# Altium project Boost_Converter.PrjPcb
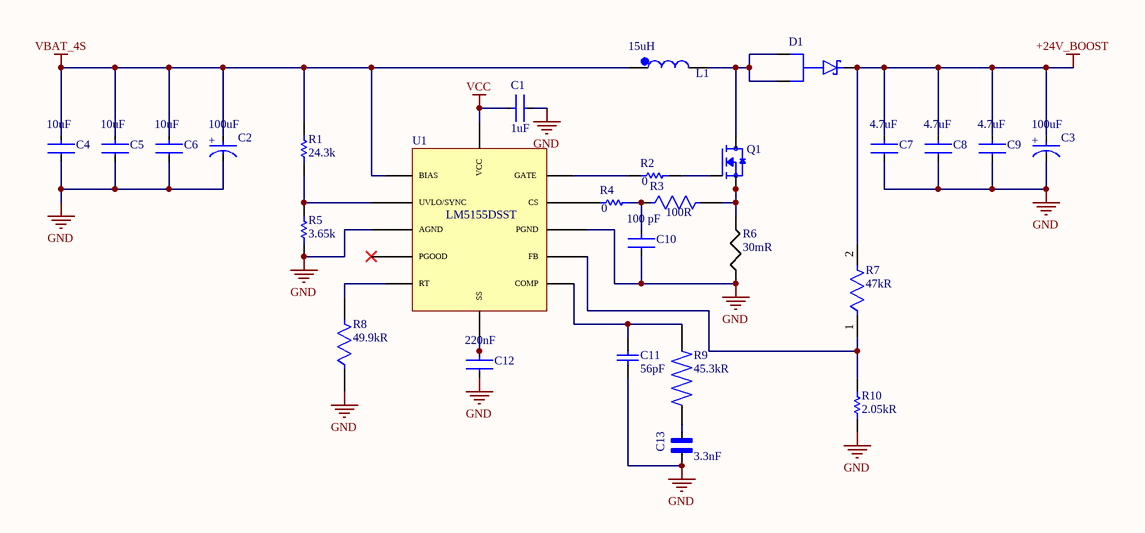
[diagram p0: boost_converter.SchDoc]
1 sheet, 27 parts. Net scope: global (net labels, ports and power ports of the same name join across sheets).
Board file: boost_converter.PcbDoc

## Sheet boost_converter.SchDoc
size A; SheetNumber: 1; SheetTotal: 1

### Parts
C1  Capacitance: 1uF  [FP-GCM188-0_1-IPC_B]  (hidden comment: C_vcc)
C2  Capacitance: 100uF  [FP-HXC-ALA0-MFG]  (hidden comment: C_in)
C3  Capacitance: 100uF  [FP-HXC-ALA0-MFG]  (hidden comment: C_out(bulk))
C4  Capacitance: 10uF  [FP-CL32-IPC_C]  (hidden comment: CL32B106KBJNNNE)
C5  Capacitance: 10uF  [FP-CL32-IPC_C]  (hidden comment: CL32B106KBJNNNE)
C6  Capacitance: 10uF  [FP-CL32-IPC_C]  (hidden comment: CL32B106KBJNNNE)
C7  Capacitance: 4.7uF  [FP-C3225-250-0_4-MFG]  (hidden comment: C_out)
C8  Capacitance: 4.7uF  [FP-C3225-250-0_4-MFG]  (hidden comment: C_out)
C9  Capacitance: 4.7uF  [FP-C3225-250-0_4-MFG]  (hidden comment: C_out)
C10  Capacitance: 100 pF  [FP-C0603C-CF-MFG]  (hidden comment: C_f)
C11  value 56pF  [CAPC1608X90X35NL10T15]  (hidden comment: C_hf)
C12  Capacitance: 220nF  [FP-GCM188-0_1-IPC_A]  (hidden comment: C_ss)
C13  value 3.3nF  [*CAPC1608X90N]  (hidden comment: C_comp)
D1  PMEG060V100EPDZ  [DIO_PMEG060V100EPDZ]  (value not drawn)
L1  value 15uH  [*IND_CSEB0660H-150M]  (hidden comment: Lm)
Q1  TSM056NH04LCR_RLG  [TRANS_TSM056NH04LCR_RLG]  (value not drawn)
R1  value 24.3k  [RESC1608X55X30NL15T15]  (hidden comment: R_uvlot)
R2  Resistance: 0  [RESC1608X55X25ML10T15]  (hidden comment: R_g)
R3  Resistance: 100R  [FP-AC0603-IPC_C]  (hidden comment: R_f)
R4  Resistance: 0  [RESC1608X55X25ML10T15]  (hidden comment: RC0603JR-070RL)
R5  value 3.65k  [RESC1608X55X30ML15T15]  (hidden comment: R_uvlob)
R6  30mR  [R_s]
R7  Resistance: 47kR  [FP-CRCW0603-e3-IPC_B]  (hidden comment: CRCW060347K0FKEA)
R8  Resistance: 49.9kR  [FP-CRCW0603-e3-IPC_B]  (hidden comment: R_t)
R9  45.3kR  [R_comp]
R10  value 2.05kR  [RESC1608X55X30ML15T15]  (hidden comment: R_fbb)
U1  LM5155DSST  [IC_LM5155DSST]

### Nets
+24V_BOOST: C3.2(A) C7.1 C8.1 C9.1 D1.3(K) R7.2
GND: C1.2 C2.1(C) C3.1(C) C4.2 C5.2 C6.2 C7.2 C8.2 C9.2 C10.2 C11.1 C12.2 C13.1 R5.1 R6.12 R8.1 R10.1 U1.16(AGND) U1.23(PGND)
VBAT_4S: C2.2(A) C4.1 C5.1 C6.1 L1.1 R1.2 U1.14(BIAS)
VCC: C1.1 U1.19(VCC)
NetC10_1: C10.1 R3.1 R4.2
NetC11_2: C11.2 R9.2 U1.21(COMP)
NetC12_1: C12.1 U1.20(SS)
NetC13_2: C13.2 R9.1
NetD1_1: D1.1(A1) D1.2(A2) L1.2 Q1.5_8(D)
NetQ1_1: Q1.1(S) Q1.2(S) Q1.3(S) R3.2 R6.13
NetQ1_4: Q1.4(G) R2.2
NetR1_1: R1.1 R5.2 U1.15(UVLO/SYNC)
NetR2_1: R2.1 U1.25(GATE)
NetR4_1: R4.1 U1.24(CS)
NetR7_1: R7.1 R10.2 U1.22(FB)
NetR8_2: R8.2 U1.18(RT)

Not connected (* = marked no-connect by the designer): U1 17(PGOOD)*

### Notes on the sheet
- (in symbol CMP-33769-000007-1) +

### Library data of the parts
C1 = CMP-2006-02357-2: Ceramic Capacitor for Automotive 1uF  ±10% 16VDC X7R 0603 Paper T/R; Voltage: 16V; Thickness: 0.035inch; Width: 0.031inch; Radiation Hardening: No; Depth: 0.8mm; Max Operating Temperature: 125°C; Package Quantity: 1; Ratings: AEC-Q200; Min Operating Temperature: -55°C; Packaging: Tape and Reel; Case Code (Metric): 1608; REACH SVHC: No SVHC; Dielectric: X7R; Case Code (Imperial): 0603; Length: 1.6mm; Height: 0.8mm; Voltage Rating: 16V; Termination: SMD/SMT; Case/Package: 0603; Voltage Rating (DC): 16V; Tolerance: 10%; Mount: Surface Mount; Lead Free: Lead Free
C2 C3 = CMP-33769-000007-1: CAP ALUM POLY 100UF 20% 50V SMD; Life (Hours): 4000Hour; ESR (Equivalent Series Resistance): 25mR; Packaging: Cut Tape; Case/Package: Radial; Resistor Type: Hybrid; Max Operating Temperature: 125°C; Voltage Rating: 50V; Min Operating Temperature: -55°C; RoHS Compliant: Yes; Tolerance: 20%; Ratings: AEC-Q200; Mount: Surface Mount
C4-C6 = CMP-2000-06110-2: Cap Ceramic 10uF 50V X7R ±10% SMD 1210 +125°C Embossed T/R; Material: Ceramic; Min Operating Temperature: -55°C; Depth: 2.5mm; Radiation Hardening: No; Packaging: Tape and Reel; Dielectric: X7R; Case Code (Metric): 3225; Height: 2.5mm; Thickness: 0.106inch; Voltage Rating (DC): 50V; Voltage Rating: 50V; Width: 0.098inch; Case Code (Imperial): 1210; Length: 3.2mm; Tolerance: 10%; Lead Free: Lead Free; Package Quantity: 1; Voltage: 50V; Mount: Surface Mount; Case/Package: 1210; Max Operating Temperature: 125°C
C7-C9 = CMP-08246-004459-1: Multilayer Ceramic Capacitors 4.7uF ±10% 50V X7R SMD 1210; Dielectric Material: Ceramic; Dielectric: X7R; Construction: Flat; Max Operating Temperature: 125°C; Case/Package: 1210; Weight: 0.000564oz; Voltage Rating: 50V; Depth: 2.5mm; Tolerance: 10%; Packaging: Tape and Reel; REACH SVHC: No SVHC; Case Code (Imperial): 1210; Thickness: 0.11inch; Termination: SMD/SMT; Radiation Hardening: No; Mount: Surface Mount; Number of Pins: 2; Min Operating Temperature: -55°C; Voltage Rating (DC): 50V; Resistor Type: Ceramic; Width: 0.098inch; Package Quantity: 1000; Length: 3.2mm; Height: 2.5mm; Case Code (Metric): 3225; Lead Free: Lead Free; RoHS Compliant: Yes; Series: C
C10 = CMP-2006-03418-2: CAP CER 100PF 50V 1% NP0 0603; Manufacturer Part Number: C0603C101F5GACTU; Manufacturer: KEMET; Material: Ceramic; Temperature Characteristic: C0G; Temperature Coefficient: 30ppm/°C; Tolerance: 0.01; Automotive Grade: Grade 1; Lead Free: Yes; Height: 0.87mm; Octopart: https://octopart.com/c0603c101f5gactu-kemet-8293493; Device Class L2: Capacitors; Device Class L1: Passive Components; ComponentLink2Description: Datasheet; Value: 100 pF; Package: C0603C-CF; Digikey Description: CAP CER 100PF 50V 1% NP0 0603; Device Class L3: Ceramic Capacitors; Mouser Description: Multilayer Ceramic Capacitors MLCC - SMD/SMT 50volts 100pF C0G 1%; Temperature: -55°C to +125°C; Category: Cap; Temperature Range High: +125°C; Temperature Range Low: -55°C; RoHS: TRUE; Voltage Rating: 50 V; Automotive: Yes; ComponentLink2URL: https://api.kemet.com/component-edge/download/datasheet/C0603C100J5GACAUTO.pdf
C11 = CMP-2006-02680-1: CAP CER 56PF 50V C0G/NP0 0603; Manufacturer: Murata; Part Number: GRM1885C1H560JA01D
C12 = CMP-2006-02383-2: Ceramic Capacitor for Automotive 220nF  ±10% 50VDC X7R 0603 Paper T/R; Voltage Rating (DC): 50V; Height: 0.8mm; Width: 0.031inch; Length: 1.6mm; Termination: SMD/SMT; Mount: Surface Mount; Depth: 0.8mm; REACH SVHC: No SVHC; Thickness: 0.035inch; Min Operating Temperature: -55°C; Case/Package: 0603; Max Operating Temperature: 125°C; Packaging: Tape and Reel; Dielectric: X7R; Package Quantity: 10; Voltage Rating: 50V; Tolerance: 10%; Ratings: AEC-Q200; Voltage: 50V; Lead Free: Lead Free; Radiation Hardening: No; Case Code (Metric): 1608; Case Code (Imperial): 0603
C13 = GRM188R72A332KA01J: CAP CER 3300PF 100V X7R 0603; SOURCE_URL: https://www.snapeda.com/parts/GRM188R72A332KA01J/Murata/view-part/?ref=snap
D1 = PMEG060V100EPDZ: Diode Schottky 60 V 10A Surface Mount CFP15; MF: Nexperia USA; SnapEDA_Link: https://www.snapeda.com/parts/PMEG060V100EPDZ/Nexperia/view-part/?ref=snap; Package: CFP15-3 Nexperia USA Inc.; Value: *; MP: PMEG060V100EPDZ; Check_prices: https://www.snapeda.com/parts/PMEG060V100EPDZ/Nexperia/view-part/?ref=eda
L1 = CSEB0660H-150M: FIXED IND 15UH 6A 43.8 MOHM SMD; MANUFACTURER: Codaca; UNIT: mm; MAXIMUM_PACKAGE_HEIGHT: 6.10mm; PARTREV: 09/15/2025; SOURCE_URL: https://www.snapeda.com/parts/CSEB0660H-150M/Codaca/view-part/?ref=snap; STANDARD: Manufacturer Recommendations
Q1 = TSM056NH04LCR_RLG: N-Channel Power Î©SFET 40V, 54A, 5.6mÎ©; MF: Taiwan Semiconductor; MP: TSM056NH04LCR RLG; SnapEDA_Link: https://www.snapeda.com/parts/TSM056NH04LCR%20RLG/taiwan/view-part/?ref=snap; Package: NON-STANDARD-5 Taiwan Semiconductor; Value: *; Check_prices: https://www.snapeda.com/parts/TSM056NH04LCR%20RLG/taiwan/view-part/?ref=eda
R1 = CMP-2000-00366-1: RES SMD 24.3K OHM 1% 1/10W 0603; Part Number: ERJ-3EKF2432V; Manufacturer: Panasonic
R2 R4 = CMP-2100-03667-1: Chip Resistor, 0 Ohm, +/- 5%, 0.1 W, -55 to 155 degC, 0603 (1608 Metric), RoHS, Tape and Reel; Manufacturer: Yageo; Temperature Coefficient: 200ppm/degreesC; Voltage Rating: 50V; Power Rating: 100mW; Width: 0.8mm; Max Operating Temperature: 155degC; Tolerance: 5%; Package Reference: 0603; Height: 0.45mm; Depth: 0.8mm; Package Description: 2-Pin Surface Mount Device, Body 1.6 x 0.8 mm; Termination: SMD/SMT; Package Quantity: 5000; Case/Package: 0603; Case Code (Imperial): 0603; Radiation Hardening: No; Number of Pins: 2; Length: 1.6mm; Lead Free: LeadFree; Voltage Rating (DC): 50V; Military Standard: Not; Datasheet URL: http://www.yageo.com/NewPortal/yageodocoutput?fileName=/pdf/R-Chip/PYu-RC_Group_51_RoHS_L_5.pdf; Manufacturer URL: http://www.yageo.com/; Packaging: TapeandReel; Case Code (Metric): 1608; Min Operating Temperature: -55degC; Composition: ThickFilm; RoHSCompliant: true; Contact Plating: Tin; Datasheet Version: Rev. 5, 10/2016; REACH SVHC: NoSVHC
R3 = CMP-2000-04817-3: RES 100Ω 1.00% 0.1W 0603; Temperature Coefficient: 100ppm/°C; Voltage Rating: 50V; Max Power Dissipation: 100mW; Tolerance: 1%; Series: AC; Height: 0.45mm; Max Operating Temperature: 155°C; Depth: 0.8mm; Lead Free: Lead Free; Packaging: Tape and Reel; Min Operating Temperature: -55°C; Number of Terminations: 2; Length: 1.6mm; RoHS Compliant: Yes; Contact Plating: Tin; Construction: Rectangular; Radiation Hardening: No; Width: 0.8mm; Power Rating: 100mW; Ratings: AEC-Q200; Termination: SMD/SMT; Resistor Type: Thick Film; Weight: 7.1E-05oz; Case Code (Metric): 1608; Military Standard: Not; Case Code (Imperial): 0603; Size Code: 0603; Features: Moisture Resistant; Case/Package: 0603
R5 = CMP-2000-00462-1: RES SMD 3.65K OHM 1% 1/10W 0603; Part Number: ERJ-3EKF3651V; Manufacturer: Panasonic
R6 = CRA2512-FZ-R030ELF: RES 0.03 OHM 1% 1W 1206; pin to pad: 12>1 13>2; Manufacturer: Bourns; Max Power Dissipation: 3W; Value: 30mΩ; Temperature Coefficient: 50ppm/°C; Supplier: Avnet; Supplier Part Number: CRA2512-FZ-R030ELF; Manufacturer Part Number: CRA2512-FZ-R030ELF; RoHS: Compliant; Category: Chip SMD Resistors; Stock: 28000; Pricing: 4000=0.20541, 8000=0.20133, 16000=0.1974, 32000=0.19363, 64000=0.12768 (USD); Case/Package: 2512; Case Code (Imperial): 2512; Case Code (Metric): 6432; China RoHS: Compliant; Composition: Metal Alloy, Metal Strip; Contact Plating: Tin; Country of Origin: Taiwan; Depth: 3.2mm; Export Control Classification Number (ECCN) Code: EAR99; Features: Moisture Resistant; Height: 700µm; Harmonized Tariff Schedule (HTS) Code: 8533.21.00.30; Introduction Date: 2008-05-23; Length: 6.4mm; Lifecycle Status: Production; Max Operating Temperature: 170°C; Military Standard: Not; Min Operating Temperature: -55°C; Mounting Technology: Surface Mount; Pins: 2; Number of Terminals: 2; Number of Terminations: 2; Packaging: Tape & Reel; Power Rating: 3W; Radiation Hardening: No; Ratings: AEC-Q200; REACH SVHC: Unaffected; Schedule B: 8533210025, 8533290000, 8533290000|8533290000|8533290000|8533290000|8533290000|8533290000|8533290000|8533290000, 8533290000|8533290000|8533290000|8533290000|8533290000|8533290000|8533290000|8533290000|8533290000; Termination: SMD/SMT; Tolerance: 1%; Weight: 40.511469mg; Width: 3.2mm; ComponentLink1URL: https://datasheet.octopart.com:443/CRA2512-FZ-R030ELF-Bourns-datasheet-169407838.pdf?src-supplier=IHS; ComponentLink1Description: https://datasheet.octopart.com:443/CRA2512-FZ-R030ELF-Bourns-datasheet-169407838.pdf?src-supplier=IHS; ComponentLink2URL: https://datasheet.octopart.com:443/CRA2512-FZ-R030ELF-Bourns-datasheet-68301994.pdf?src-supplier=Burklin+Elektronik; ComponentLink2Description: https://datasheet.octopart.com:443/CRA2512-FZ-R030ELF-Bourns-datasheet-68301994.pdf?src-supplier=Burklin+Elektronik; ComponentLink3URL: https://datasheet.octopart.com:443/CRA2512-FZ-R030ELF-Bourns-datasheet-32543139.pdf?src-supplier=element14+APAC; ComponentLink3Description: https://datasheet.octopart.com:443/CRA2512-FZ-R030ELF-Bourns-datasheet-32543139.pdf?src-supplier=element14+APAC; ComponentLink4URL: https://datasheet.octopart.com:443/CRA2512-FZ-R030ELF-Bourns-datasheet-15983344.pdf?src-supplier=element14+APAC; ComponentLink4Description: https://datasheet.octopart.com:443/CRA2512-FZ-R030ELF-Bourns-datasheet-15983344.pdf?src-supplier=element14+APAC; ComponentLink5URL: https://datasheet.octopart.com:443/CRA2512-FZ-R030ELF-Bourns-datasheet-26822206.pdf?src-supplier=Farnell; ComponentLink5Description: https://datasheet.octopart.com:443/CRA2512-FZ-R030ELF-Bourns-datasheet-26822206.pdf?src-supplier=Farnell; ComponentLink6URL: https://datasheet.octopart.com:443/CRA2512-FZ-R030ELF-Bourns-datasheet-21630808.pdf?src-supplier=Farnell; ComponentLink6Description: https://datasheet.octopart.com:443/CRA2512-FZ-R030ELF-Bourns-datasheet-21630808.pdf?src-supplier=Farnell; ComponentLink7URL: https://datasheet.octopart.com:443/CRA2512-FZ-R030ELF-Bourns-datasheet-154729667.pdf?src-supplier=Electro+Sonic; ComponentLink7Description: https://datasheet.octopart.com:443/CRA2512-FZ-R030ELF-Bourns-datasheet-154729667.pdf?src-supplier=Electro+Sonic; ComponentLink8URL: https://datasheet.octopart.com:443/CRA2512-FZ-R030ELF-Bourns-datasheet-8519302.pdf?src-supplier=RS+(Formerly+Allied+Electronics); ComponentLink8Description: https://datasheet.octopart.com:443/CRA2512-FZ-R030ELF-Bourns-datasheet-8519302.pdf?src-supplier=RS+(Formerly+Allied+Electronics); ComponentLink9URL: https://datasheet.octopart.com:443/CRA2512-FZ-R030ELF-Bourns-datasheet-57227053.pdf?src-supplier=RS+(Formerly+Allied+Electronics); ComponentLink9Description: https://datasheet.octopart.com:443/CRA2512-FZ-R030ELF-Bourns-datasheet-57227053.pdf?src-supplier=RS+(Formerly+Allied+Electronics); ComponentLink10URL: https://datasheet.octopart.com:443/CRA2512-FZ-R030ELF-Bourns-datasheet-190051968.pdf?src-supplier=Newark; ComponentLink10Description: https://datasheet.octopart.com:443/CRA2512-FZ-R030ELF-Bourns-datasheet-190051968.pdf?src-supplier=Newark; ComponentLink11URL: https://datasheet.octopart.com:443/CRA2512-FZ-R030ELF-Bourns-datasheet-10633406.pdf?src-supplier=element14; ComponentLink11Description: https://datasheet.octopart.com:443/CRA2512-FZ-R030ELF-Bourns-datasheet-10633406.pdf?src-supplier=element14; ComponentLink12URL: http://sigma.octopart.com:80/conflict_mineral_statement/Bourns-company-36.pdf?src-supplier=Compliance+Statements; ComponentLink12Description: http://sigma.octopart.com:80/conflict_mineral_statement/Bourns-company-36.pdf?src-supplier=Compliance+Statements
R7 = CMP-2000-03379-3: RES SMD 47K OHM 1% 1/10W 0603; Voltage Rating: 75V; Max Power Dissipation: 100mW; Temperature Coefficient: 100ppm/°C; Size Code: 0603; Technology: THICK FILM; Case Code (Metric): 1608; Radiation Hardening: No; Case/Package: 0603; Number of Terminations: 2; Package Quantity: 5000; Width: 0.85mm; Series: CRCW; RoHS Compliant: Yes; Case Code (Imperial): 0603; Lead Free: Lead Free; Resistance Tolerance: 1%; Depth: 0.85mm; Contact Plating: Tin; Tolerance: 1%; Voltage Rating (DC): 75V; Min Operating Temperature: -55°C; Mount: Surface Mount; Packaging: Tape and Reel; Length: 1.55mm; Resistor Type: Thick Film; Features: Automotive AEC-Q200; Max Operating Temperature: 155°C; Weight: 7.1E-05oz; Construction: Rectangular; Height: 0.45mm; Military Standard: Not; Termination: SMD/SMT; Power Rating: 100mW
R8 = CMP-1012-00702-8: RES Thick Film, 49.9kΩ, 1%, 0.1W, 100ppm/°C, 0603; Working Voltage: 75V; Power Rating: 100mW; Composition: Thick Film; Height: 0.45mm; Voltage Rating: 75V; Tolerance: 1%; Depth: 0.85mm; Contact Plating: Tin; Number of Terminations: 2; Mount: Surface Mount; Termination: SMD/SMT; Case Code (Imperial): 0603; Max Operating Temperature: 155°C; Weight: 7.1E-05oz; Lead Free: Lead Free; Length: 1.55mm; Width: 0.033inch; Voltage Rating (DC): 75V; Temperature Coefficient: 100ppm/°C; Packaging: Tape and Reel; Features: Automotive AEC-Q200; Military Standard: Not; Package Quantity: 10; Case/Package: 0603; Case Code (Metric): 1608; Min Operating Temperature: -55°C; Max Power Dissipation: 100mW
R9 = ERJ3EKF4532V: 45.3 kOhms Â±1% 0.1W, 1/10W Chip Resistor 0603 (1608 Metric) Automotive AEC-Q200 Thick Film; MF: Panasonic; SnapEDA_Link: https://www.snapeda.com/parts/ERJ3EKF4532V/Panasonic/view-part/?ref=snap; Package: 1608-2 Panasonic; Value: *; MP: ERJ3EKF4532V; Check_prices: https://www.snapeda.com/parts/ERJ3EKF4532V/Panasonic/view-part/?ref=eda; Supplier 1: Avnet; Supplier Part Number 1: ERJ3EKF4532V
R10 = CMP-2000-00322-1: RES SMD 2.05K OHM 1% 1/10W 0603; Part Number: ERJ-3EKF2051V; Manufacturer: Panasonic
U1 = LM5155DSST_1: pin to pad: 14>1 15>2 16>3 17>4 18>5 19>6 20>7 21>8 22>9 23>10 24>11 25>12; MF: {'manufacturer': u'Texas Instruments'}; Package: None; Price: None; Value: *; MP: LM5155DSST; Availability: Unavailable